# Altium schematic sheet top-sheet.SchDoc: CDR
size 420 x 297 mm; CheckedBy: E.Orzes F.Martina S.Baron; CompanyName: CERN; DrawnBy: E.Orzes; Organization: CERN; Address1: European Organization for Nuclear Research; Address2: CH-1211 Genève 23 - Switzerland; SheetNumber: 1; SheetTotal: 2; Projet: CDR Evalutation Board; DivGrp: EP-ESE; Designer: E.Orzes; ModifiedDate: -
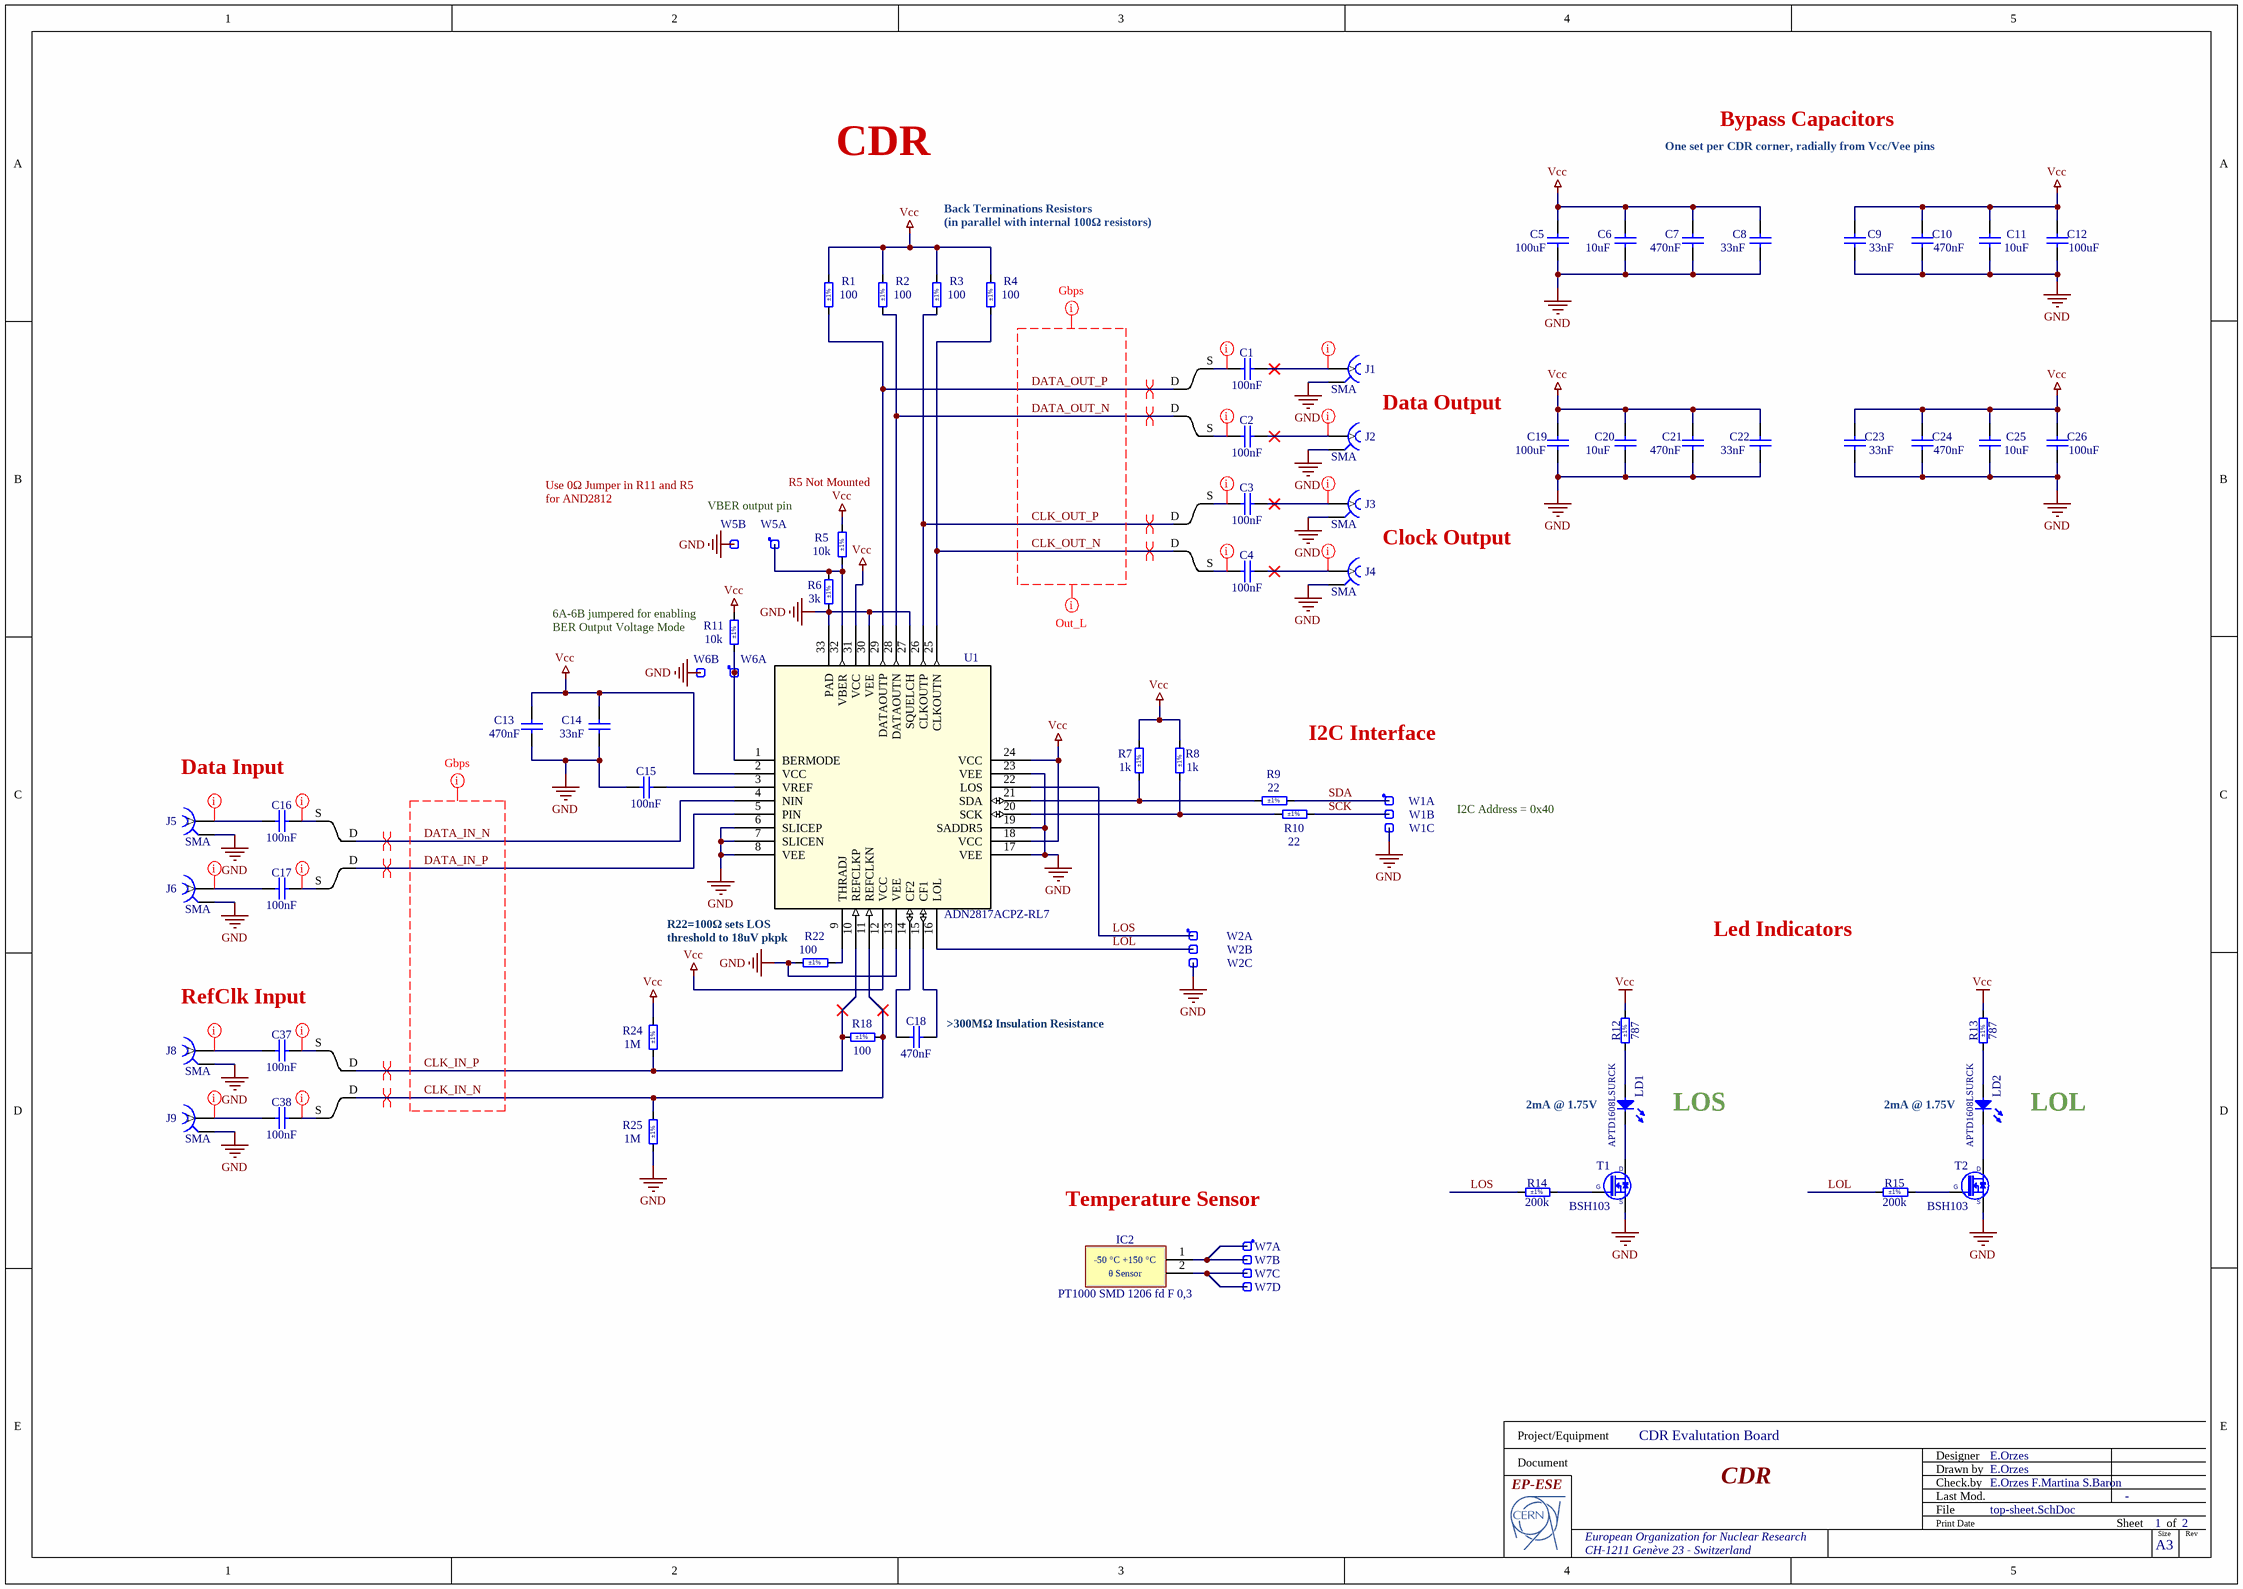
[diagram p0: top-sheet.SchDoc]

## Parts
C1  100nF  [CAPC0603X33N]
C2  100nF  [CAPC0603X33N]
C3  100nF  [CAPC0603X33N]
C4  100nF  [CAPC0603X33N]
C5  100uF  [CAPC3225X270N]
C6  10uF  [CAPC1608X87N]
C7  470nF  [CAPC0510X04N]
C8  33nF  [LLL03TR61E333KE01]
C9  33nF  [LLL03TR61E333KE01]
C10  470nF  [CAPC0510X04N]
C11  10uF  [CAPC1608X87N]
C12  100uF  [CAPC3225X270N]
C13  470nF  [CAPC0510X04N]
C14  33nF  [LLL03TR61E333KE01]
C15  100nF  [CAPC0603X33N]
C16  100nF  [CAPC0603X33N]
C17  100nF  [CAPC0603X33N]
C18  470nF  [CAPC2013X140N]
C19  100uF  [CAPC3225X270N]
C20  10uF  [CAPC1608X87N]
C21  470nF  [CAPC0510X04N]
C22  33nF  [LLL03TR61E333KE01]
C23  33nF  [LLL03TR61E333KE01]
C24  470nF  [CAPC0510X04N]
C25  10uF  [CAPC1608X87N]
C26  100uF  [CAPC3225X270N]
C37  100nF  [CAPC0603X33N]
C38  100nF  [CAPC0603X33N]
IC2  PT1000 SMD 1206 fd F 0,3  [DFN310X150X55-2N]
J1  SMA  [SAMTEC_SMA-J-P-H-ST-MT1]
J2  SMA  [SAMTEC_SMA-J-P-H-ST-MT1]
J3  SMA  [SAMTEC_SMA-J-P-H-ST-MT1]
J4  SMA  [SAMTEC_SMA-J-P-H-ST-MT1]
J5  SMA  [SAMTEC_SMA-J-P-H-ST-MT1]
J6  SMA  [SAMTEC_SMA-J-P-H-ST-MT1]
J8  SMA  [SAMTEC_SMA-J-P-H-ST-MT1]
J9  SMA  [SAMTEC_SMA-J-P-H-ST-MT1]
LD1  APTD1608LSURCK  [LED_KINGBRIGHT_KP-1608SURCK]
LD2  APTD1608LSURCK  [LED_KINGBRIGHT_KP-1608SURCK]
R1  100  Tolerance: ±1%  [RESC0603X28N]
R2  100  Tolerance: ±1%  [RESC0603X28N]
R3  100  Tolerance: ±1%  [RESC0603X28N]
R4  100  Tolerance: ±1%  [RESC0603X28N]
R5  10k  Tolerance: ±1%  [RESC1005X40N]
R6  3k  Tolerance: ±1%  [RESC1005X40N]
R7  1k  Tolerance: ±1%  [RESC1005X40N]
R8  1k  Tolerance: ±1%  [RESC1005X40N]
R9  22  Tolerance: ±1%  [RESC1005X40N]
R10  22  Tolerance: ±1%  [RESC1005X40N]
R11  10k  Tolerance: ±1%  [RESC1005X40N]
R12  787  Tolerance: ±1%  [RESC1005X40N]
R13  787  Tolerance: ±1%  [RESC1005X40N]
R14  200k  Tolerance: ±1%  [RESC1005X40N]
R15  200k  Tolerance: ±1%  [RESC1005X40N]
R18  100  Tolerance: ±1%  [RESC0603X28N]
R22  100  Tolerance: ±1%  [RESC0603X28N]
R24  1M  Tolerance: ±1%  [RESC1005X40N]
R25  1M  Tolerance: ±1%  [RESC1005X40N]
T1  BSH103  [SOT95P230X110-3N]
T2  BSH103  [SOT95P230X110-3N]
TA1  Differential to Single Transition  [lane_width_transition]  (value not drawn)  (net tie, no BOM)
TA2  Differential to Single Transition  [lane_width_transition]  (value not drawn)  (net tie, no BOM)
TA3  Differential to Single Transition  [lane_width_transition]  (value not drawn)  (net tie, no BOM)
TA4  Differential to Single Transition  [lane_width_transition]  (value not drawn)  (net tie, no BOM)
TA5  Differential to Single Transition  [lane_width_transition]  (value not drawn)  (net tie, no BOM)
TA6  Differential to Single Transition  [lane_width_transition]  (value not drawn)  (net tie, no BOM)
TA7  Differential to Single Transition  [lane_width_transition]  (value not drawn)  (net tie, no BOM)
TA8  Differential to Single Transition  [lane_width_transition]  (value not drawn)  (net tie, no BOM)
U1  ADN2817ACPZ-RL7  [CP_32_11_ADI]
W1  Header 3  [SAMTEC_HTSW-103-23-L-S]  (value not drawn)  (parts A,B,C of 3)
W2  Header 3  [SAMTEC_HTSW-103-23-L-S]  (value not drawn)  (parts A,B,C of 3)
W5  Header 2  [SAMTEC_HTSW-102-23-L-S]  (value not drawn)  (parts A,B of 2)
W6  Header 2  [SAMTEC_HTSW-102-23-L-S]  (value not drawn)  (parts A,B of 2)
W7  Header 4  [SAMTEC_HTSW-104-23-L-S]  (value not drawn)  (parts A,B,C,D of 4)

## Nets
GND: C5.1 C6.1 C7.1 C8.1 C9.1 C10.1 C11.1 C12.1 C13.1 C14.1 C15.1 C19.1 C20.1 C21.1 C22.1 C23.1 C24.1 C25.1 C26.1 J1.2 J2.2 J3.2 J4.2 J5.2 J6.2 J8.2 J9.2 R6.1 R22.1 R25.1 T1.2(S) T2.2(S) U1.6(SLICEP) U1.7(SLICEN) U1.8(VEE) U1.13(VEE) U1.17(VEE) U1.19(SADDR5) U1.23(VEE) U1.27(SQUELCH) U1.30(VEE) U1.33(PAD) W1.3 W2.3 W5.2 W6.2
Vcc: C5.2 C6.2 C7.2 C8.2 C9.2 C10.2 C11.2 C12.2 C13.2 C14.2 C19.2 C20.2 C21.2 C22.2 C23.2 C24.2 C25.2 C26.2 R1.2 R2.2 R3.2 R4.2 R5.2 R7.2 R8.2 R11.2 R12.2 R13.2 R24.2 U1.2(VCC) U1.12(VCC) U1.18(VCC) U1.24(VCC) U1.31(VCC)
CLK_IN_N: R18.2 R25.2 TA8.D U1.11(REFCLKN)
CLK_IN_P: R18.1 R24.1 TA7.D U1.10(REFCLKP)
CLK_OUT_N: R4.1 TA4.D U1.25(CLKOUTN)
CLK_OUT_P: R3.1 TA3.D U1.26(CLKOUTP)
DATA_IN_N: TA5.D U1.4(NIN)
DATA_IN_P: TA6.D U1.5(PIN)
DATA_OUT_N: R2.1 TA2.D U1.28(DATAOUTN)
DATA_OUT_P: R1.1 TA1.D U1.29(DATAOUTP)
LOL: R15.1 U1.16(LOL) W2.2
LOS: R14.1 U1.22(LOS) W2.1
SCK: R10.2 W1.2
SDA: R9.2 W1.1
NetC1_1: C1.1 TA1.S
NetC1_2: C1.2 J1.1
NetC2_1: C2.1 TA2.S
NetC2_2: C2.2 J2.1
NetC3_1: C3.1 TA3.S
NetC3_2: C3.2 J3.1
NetC4_1: C4.1 TA4.S
NetC4_2: C4.2 J4.1
NetC15_2: C15.2 U1.3(VREF)
NetC16_1: C16.1 J5.1
NetC16_2: C16.2 TA5.S
NetC17_1: C17.1 J6.1
NetC17_2: C17.2 TA6.S
NetC18_1: C18.1 U1.14(CF2)
NetC18_2: C18.2 U1.15(CF1)
NetC37_1: C37.1 J8.1
NetC37_2: C37.2 TA7.S
NetC38_1: C38.1 J9.1
NetC38_2: C38.2 TA8.S
NetIC2_1: IC2.1 W7.1 W7.2
NetIC2_2: IC2.2 W7.3 W7.4
NetLD1_1: LD1.1(C) T1.3(D)
NetLD1_2: LD1.2(A) R12.1
NetLD2_1: LD2.1(C) T2.3(D)
NetLD2_2: LD2.2(A) R13.1
NetR5_1: R5.1 R6.2 U1.32(VBER) W5.1
NetR7_1: R7.1 R9.1 U1.21(SDA)
NetR8_1: R8.1 R10.1 U1.20(SCK)
NetR11_1: R11.1 U1.1(BERMODE) W6.1
NetR14_2: R14.2 T1.1(G)
NetR15_2: R15.2 T2.1(G)
NetR22_2: R22.2 U1.9(THRADJ)

## Layout directives
differential pair: CLK_IN_N, CLK_IN_P, CLK_OUT_N, CLK_OUT_P, DATA_IN_N, DATA_IN_P, DATA_OUT_N, DATA_OUT_P
mark named Gbps: CLK_IN_N, CLK_IN_P, CLK_OUT_N, CLK_OUT_P, DATA_IN_N, DATA_IN_P, DATA_OUT_N, DATA_OUT_P
net class Output_Lanes: CLK_OUT_N, CLK_OUT_P, DATA_OUT_N, DATA_OUT_P
net class 50ohm: NetC1_1, NetC1_2, NetC2_1, NetC2_2, NetC3_1, NetC3_2, NetC4_1, NetC4_2, NetC16_1, NetC16_2, NetC17_1, NetC17_2, NetC37_1, NetC37_2, NetC38_1, NetC38_2

## Notes on the sheet
- Bypass Capacitors
- CDR
- One set per CDR corner, radially from Vcc/Vee pins
- Back Terminations Resistors
  (in parallel with internal 100Ω resistors)
- Data Output
- (near W5) Use 0Ω Jumper in R11 and R5 for AND2812
- (near W5) VBER output pin
- R5 Not Mounted
- Clock Output
- 6A-6B jumpered for enabling BER Output Voltage Mode
- Data Input
- I2C Interface
- I2C Address = 0x40
- (near U1) R22=100Ω sets LOS threshold to 18uV pkpk
- Led Indicators
- RefClk Input
- (near C18) >300MΩ Insulation Resistance
- (near LD1) 2mA @ 1.75V
- LOS
- (near LD2) 2mA @ 1.75V
- LOL
- Temperature Sensor
- Project/Equipment
- Document
- Designer
- Drawn by
- Check.by
- File
- Last Mod.
- Print Date
- Sheet
- Size
- A3
- of
- Rev
- (in symbol PT1000 SMD 1206 fd F 0,3) -50 °C +150 °C; θ Sensor

## Library data of the parts
C1-C4 C15-C17 C37 C38 = CC0201_100NF_6.3V_10%_X7R: Non-polarised capacitor; Part Description: SMD Multilayer Chip Ceramic Capacitor; Manufacturer: GENERIC; Manufacturer1 Part Number: CC0201KRX7R5BB104; Voltage: 6.3V; TC: X7R; Tolerance: ±10%; Part Number: CC0201_100NF_6.3V_10%_X7R; Component Kind: Standard; Component Type: Standard; Pin Count: 2; Value: 100nF; Status: Not Recommended; Manufacturer Part Number: CC0201_100NF_6.3V_10%_X7R; Case: 0201; Mounted: Yes; Socket: No; SMD: Yes; Sense: No; Manufacturer1 Example: YAGEO PHYCOMP; Manufacturer1 ComponentHeight: 0.33mm; HelpURL: \\cern.ch\dfs\Applications\Altium\Datasheets\CC0201_X7R_YAGEO_6.3VTO50V.pdf; Author: CERN DEM BC; CreateDate: 11/20/2020; LatestRevisionDate: 11/20/2020
C5 C12 C19 C26 = CC1210_100UF_6.3V_20%_X7U: GRM32EC70J107ME15; Part Description: SMD Multilayer Chip Ceramic Capacitor; Manufacturer: GENERIC; Manufacturer1 Part Number: GRM32EE70J107ME15L; Voltage: 6.3V; TC: X7U; Tolerance: ±20%; Part Number: CC1210_100UF_6.3V_20%_X7U; Component Kind: Standard; Component Type: Standard; Pin Count: 2; Value: 100uF; Status: None; Manufacturer Part Number: CC1210_100UF_6.3V_20%_X7U; Case: 1210; Mounted: Yes; Socket: No; SMD: Yes; Sense: No; Manufacturer1 Example: MURATA; Manufacturer1 ComponentHeight: 2.7mm; HelpURL: \\cern.ch\dfs\Applications\Altium\Datasheets\CC1210_X7U_MURATA.pdf; Author: CERN DEM MR; CreateDate: 10/12/2017; LatestRevisionDate: 10/12/2017
C6 C11 C20 C25 = CC0603_10UF_6.3V_20%_X5R: GRM188D71A106KA73; Part Description: SMD Multilayer Chip Ceramic Capacitor; Manufacturer: GENERIC; Manufacturer1 Part Number: C0603C106M9PAC; Voltage: 6.3V; TC: X5R; Tolerance: ±20%; Part Number: CC0603_10UF_6.3V_20%_X5R; Component Kind: Standard; Component Type: Standard; Pin Count: 2; Value: 10uF; Status: Preferred; Manufacturer Part Number: CC0603_10uF_6.3V_20%_X5R; Case: 0603; Mounted: Yes; Socket: No; SMD: Yes; Sense: No; Manufacturer1 Example: KEMET; Manufacturer1 ComponentHeight: 0.95mm; HelpURL: \\cern.ch\dfs\Applications\Altium\Datasheets\CC0603_X5R_KEMET.pdf; Author: CERN DEM JLC; CreateDate: 03/12/2007; LatestRevisionDate: 03/12/2007
C7 C10 C13 C21 C24 = Capacitor - non polarized: LLL153C70G474ME17; Value: 470nF
C8 C9 C14 C22 C23 = Capacitor - non polarized: LLL03TR61E333KE01; Value: 33nF
C18 = CC0805_470NF_50V_10%_X7R_MURATA_GCM21BR71H474KA55L: GCM21BR71H474KA55L; Part Description: SMD Chip Monolithic Ceramic Capacitor for Automotive; Manufacturer: MURATA; Voltage: 50V; TC: X7R; Tolerance: ±10%; Part Number: CC0805_470NF_50V_10%_X7R_MURATA_GCM21BR71H474KA55L; Component Kind: Standard; Component Type: Standard; Pin Count: 2; Value: 470nF; Status: Not Recommended; Manufacturer Part Number: GCM21BR71H474KA55L; Case: 0805; Mounted: Yes; Socket: No; SMD: Yes; Sense: No; ComponentHeight: 1.4mm; HelpURL: \\cern.ch\dfs\Applications\Altium\Datasheets\CC0805_MURATA_GCM21BR71H474KA55L.pdf; Author: CERN DEM JLC; CreateDate: 5/10/2017; LatestRevisionDate: 5/10/2017
IC2 = PT1000 SMD 1206 fd F 0,3: 2 Pin Temperature Sensor; Part Description: -50°C to +150°C, 1000 Ohm at 0°C Platinum Temperature Sensor; Manufacturer: UMWELTSENSORTECHNIK GmbH (UST); PressFit: No; Bonding: No; Part Number: PT1000 SMD 1206 fd F 0,3; Component Kind: Standard; Component Type: Standard; Device: PT1000 SMD 1206 fd F 0,3; PackageDescription: DFN; 2 Pin,3.10mm L X 1.50mm W X 0.40mm H, IPC Medium Density; Manufacturer Part Number: PT1000 SMD 1206 fd F 0,3; Pin Count: 2; Case: DFN2; Mounted: Yes; Socket: No; SMD: Yes; Sense: No; ComponentHeight: 0.55mm; HelpURL: \\cern.ch\dfs\Applications\Altium\Datasheets\PT1000 SMD 1206 fd.pdf; Author: CERN DEM JLC; CreateDate: 8/20/2018; LatestRevisionDate: 8/22/2018
J1-J6 J8 J9 = SAMTEC_SMA-J-P-H-ST-MT1: Part Description: 50 Ohms SMA Straight Mixed Technology PCB Jack; Manufacturer: SAMTEC; PressFit: No; Sense Comment: assembly limitations; Part Number: SAMTEC_SMA-J-P-H-ST-MT1; Component Kind: Standard; Component Type: Standard; Pin Count: 5; Family: SMA; Mounted: Yes; Socket: No; SMD: Yes; Sense: Yes; Status: Not Recommended; Manufacturer Part Number: SMA-J-P-H-ST-MT1; ComponentHeight: 7.95mm; HelpURL: \\cern.ch\dfs\Applications\Altium\Datasheets\SAMTEC_SMA-J-P-H-ST-MT1.pdf; Author: CERN DEM HF; CreateDate: 5/24/2023; LatestRevisionDate: 5/24/2023
LD1 LD2 = LED_KINGBRIGHT_KP-1608SURCK: LED Red 1C 2A; Part Description: 1.6x0.8mm SMD Chip Hyper Red LED Lamp; PressFit: No; Bonding: No; Part Number: LED_KINGBRIGHT_KP-1608SURCK; Component Kind: Standard; Component Type: Standard; Color: Red; PackageDescription: SMT Hyper Red LED, Case 0603, Body L 1.60mm x W 0.80mm x H 1.10mm; Manufacturer: KINGBRIGHT; Manufacturer Part Number: KP-1608SURCK; Pin Count: 2; Case: 0603; Mounted: Yes; Socket: No; SMD: Yes; Sense: No; ComponentHeight: 1.1mm; HelpURL: \\cern.ch\dfs\Applications\Altium\Datasheets\LED_KINGBRIGHT_KP-1608SURCK.pdf; Author: CERN DEM HF; CreateDate: 10/1/2021; LatestRevisionDate: 10/1/2021
R1-R4 R18 R22 = R0201_100R_1%_0.05W_200PPM: Resistor - 1%; Part Description: Thick Film Chip Resistor; Manufacturer: GENERIC; Manufacturer1 Part Number: CRCW0201100RFNED; Power: 0.05W; TC: ±200ppm/°C; PressFit: No; Part Number: R0201_100R_1%_0.05W_200PPM; Component Kind: Standard; Component Type: Standard; Pin Count: 2; Value: 100; Status: Not Recommended; Manufacturer Part Number: R0201_100R_1%_0.05W_200PPM; Case: 0201; Mounted: Yes; Sense: No; Socket: No; SMD: Yes; Manufacturer1 Example: VISHAY; Manufacturer1 ComponentHeight: 0.27mm; HelpURL: \\cern.ch\dfs\Applications\Altium\Datasheets\R0201_VISHAY_CRCW e3.pdf; Author: CERN DEM JLC; CreateDate: 11/13/2014; LatestRevisionDate: 11/13/2014
R5 = R0402_10K_1%_0.0625W_100PPM: Resistor - 1%; Part Description: General Purpose Thick Film Chip Resistor; Manufacturer: GENERIC; Manufacturer1 Part Number: 232270671003L; TC: ±100ppm/°C; PressFit: No; Mounted: No; Part Number: R0402_10K_1%_0.0625W_100PPM; Component Kind: Standard; Component Type: Standard; Pin Count: 2; Value: 10k; Status: Not Recommended; Power: 0.0625W; Manufacturer Part Number: R0402_10K_1%_0.0625W_100PPM; Case: 0402; Sense: No; Socket: No; SMD: Yes; Manufacturer1 Example: YAGEO PHYCOMP; Manufacturer1 ComponentHeight: 0.4mm; HelpURL: \\cern.ch\dfs\Applications\Altium\Datasheets\R0402_Phycomp_RC0402.pdf; Author: CERN DEM JLC; CreateDate: 12/3/2007; LatestRevisionDate: 10/17/2012
R6 = R0402_3K_1%_0.0625W_100PPM: Resistor - 1%; Part Description: General Purpose Thick Film Chip Resistor; Manufacturer: GENERIC; Manufacturer1 Part Number: 232270673002L; TC: ±100ppm/°C; PressFit: No; Part Number: R0402_3K_1%_0.0625W_100PPM; Component Kind: Standard; Component Type: Standard; Pin Count: 2; Value: 3k; Status: Not Recommended; Power: 0.0625W; Manufacturer Part Number: R0402_3K_1%_0.0625W_100PPM; Case: 0402; Mounted: Yes; Sense: No; Socket: No; SMD: Yes; Manufacturer1 Example: YAGEO PHYCOMP; Manufacturer1 ComponentHeight: 0.4mm; HelpURL: \\cern.ch\dfs\Applications\Altium\Datasheets\R0402_Phycomp_RC0402.pdf; Author: CERN DEM JLC; CreateDate: 12/3/2007; LatestRevisionDate: 10/17/2012
R7 R8 = R0402_1K_1%_0.0625W_100PPM: Resistor - 1%; Part Description: General Purpose Thick Film Chip Resistor; Manufacturer: GENERIC; Manufacturer1 Part Number: 232270671002L; TC: ±100ppm/°C; PressFit: No; Part Number: R0402_1K_1%_0.0625W_100PPM; Component Kind: Standard; Component Type: Standard; Pin Count: 2; Value: 1k; Status: Not Recommended; Power: 0.0625W; Manufacturer Part Number: R0402_1K_1%_0.0625W_100PPM; Case: 0402; Mounted: Yes; Sense: No; Socket: No; SMD: Yes; Manufacturer1 Example: YAGEO PHYCOMP; Manufacturer1 ComponentHeight: 0.4mm; HelpURL: \\cern.ch\dfs\Applications\Altium\Datasheets\R0402_Phycomp_RC0402.pdf; Author: CERN DEM JLC; CreateDate: 12/3/2007; LatestRevisionDate: 10/17/2012
R9 R10 = R0402_22R_1%_0.0625W_100PPM: Resistor - 1%; Part Description: General Purpose Thick Film Chip Resistor; Manufacturer: GENERIC; Manufacturer1 Part Number: 232270672209L; TC: ±100ppm/°C; PressFit: No; Part Number: R0402_22R_1%_0.0625W_100PPM; Component Kind: Standard; Component Type: Standard; Pin Count: 2; Value: 22; Status: Not Recommended; Power: 0.0625W; Manufacturer Part Number: R0402_22R_1%_0.0625W_100PPM; Case: 0402; Mounted: Yes; Sense: No; Socket: No; SMD: Yes; Manufacturer1 Example: YAGEO PHYCOMP; Manufacturer1 ComponentHeight: 0.4mm; HelpURL: \\cern.ch\dfs\Applications\Altium\Datasheets\R0402_Phycomp_RC0402.pdf; Author: CERN DEM JLC; CreateDate: 12/3/2007; LatestRevisionDate: 10/17/2012
R11 = R0402_10K_1%_0.0625W_100PPM: Resistor - 1%; Part Description: General Purpose Thick Film Chip Resistor; Manufacturer: GENERIC; Manufacturer1 Part Number: 232270671003L; TC: ±100ppm/°C; PressFit: No; Part Number: R0402_10K_1%_0.0625W_100PPM; Component Kind: Standard; Component Type: Standard; Pin Count: 2; Value: 10k; Status: Not Recommended; Power: 0.0625W; Manufacturer Part Number: R0402_10K_1%_0.0625W_100PPM; Case: 0402; Mounted: Yes; Sense: No; Socket: No; SMD: Yes; Manufacturer1 Example: YAGEO PHYCOMP; Manufacturer1 ComponentHeight: 0.4mm; HelpURL: \\cern.ch\dfs\Applications\Altium\Datasheets\R0402_Phycomp_RC0402.pdf; Author: CERN DEM JLC; CreateDate: 12/3/2007; LatestRevisionDate: 10/17/2012
R12 R13 = R0402_787R_1%_0.1W_100PPM: Resistor - 1%; Part Description: General Purpose Thick Film Chip Resistor; Manufacturer: GENERIC; Manufacturer1 Part Number: ERJ2RKF7870X; Power: 0.1W; TC: ±100ppm/°C; Voltage: 50V; PressFit: No; Part Number: R0402_787R_1%_0.1W_100PPM; Component Kind: Standard; Component Type: Standard; Pin Count: 2; Value: 787; Status: Not Recommended; Manufacturer Part Number: R0402_787R_1%_0.1W_100PPM; Case: 0402; Mounted: Yes; Sense: No; Socket: No; SMD: Yes; Manufacturer1 Example: PANASONIC; Manufacturer1 ComponentHeight: 0.4mm; HelpURL: \\cern.ch\dfs\Applications\Altium\Datasheets\R0402_PANASONIC_ERJ2RK.pdf; Author: CERN DEM BC; CreateDate: 9/14/2020; LatestRevisionDate: 9/14/2020
R14 R15 = R0402_200K_1%_0.0625W_100PPM: Resistor - 1%; Part Description: General Purpose Thick Film Chip Resistor; Manufacturer: GENERIC; Manufacturer1 Part Number: 232270672004L; TC: ±100ppm/°C; PressFit: No; Part Number: R0402_200K_1%_0.0625W_100PPM; Component Kind: Standard; Component Type: Standard; Pin Count: 2; Value: 200k; Status: Not Recommended; Power: 0.0625W; Manufacturer Part Number: R0402_200K_1%_0.0625W_100PPM; Case: 0402; Mounted: Yes; Sense: No; Socket: No; SMD: Yes; Manufacturer1 Example: YAGEO PHYCOMP; Manufacturer1 ComponentHeight: 0.4mm; HelpURL: \\cern.ch\dfs\Applications\Altium\Datasheets\R0402_Phycomp_RC0402.pdf; Author: CERN DEM JLC; CreateDate: 12/3/2007; LatestRevisionDate: 10/17/2012
R24 R25 = R0402_1M_1%_0.0625W_100PPM: Resistor - 1%; Part Description: General Purpose Thick Film Chip Resistor; Manufacturer: GENERIC; Manufacturer1 Part Number: 232270671005L; TC: ±100ppm/°C; PressFit: No; Part Number: R0402_1M_1%_0.0625W_100PPM; Component Kind: Standard; Component Type: Standard; Pin Count: 2; Value: 1M; Status: Not Recommended; Power: 0.0625W; Manufacturer Part Number: R0402_1M_1%_0.0625W_100PPM; Case: 0402; Mounted: Yes; Sense: No; Socket: No; SMD: Yes; Manufacturer1 Example: YAGEO PHYCOMP; Manufacturer1 ComponentHeight: 0.4mm; HelpURL: \\cern.ch\dfs\Applications\Altium\Datasheets\R0402_Phycomp_RC0402.pdf; Author: CERN DEM JLC; CreateDate: 12/3/2007; LatestRevisionDate: 10/17/2012
T1 T2 = BSH103: N-CHANNEL MOSFET WITH DIODE; Part Description: 30V, 850mA N-Channel Enhancement Mode Field-Effect Transistor; Manufacturer: NEXPERIA; PressFit: No; Bonding: No; Part Number: BSH103; Component Kind: Standard; Component Type: Standard; Device: BSH103; PackageDescription: SOT23, 0.95mm Pitch; 3 Pin, 1.30mm W X 2.90mm L X 1.10mm H body, IPC Medium Density; Manufacturer Part Number: BSH103; Pin Count: 3; Case: SOT23-3; Mounted: Yes; Socket: No; SMD: Yes; Sense: No; ComponentHeight: 1.1mm; HelpURL: \\cern.ch\dfs\Applications\Altium\Datasheets\BSH103.pdf; Author: CERN DEM JLC; CreateDate: 16/03/2010; LatestRevisionDate: 20/06/2017
TA1-TA8 = lane_width_transition
U1 = ADN2817ACPZ-RL7: No Description Available; Mfr_Name: Analog Devices Inc; RefDes: RefDes; Type: Type
W1 W2 = SAMTEC_HTSW-103-23-L-S: 3 Mini Wire-Wrap Contact Strip Header; Part Description: 3 Contacts, Pitch 2.54mm, Single Row Through Mount Straight Header (Post Lead 5.84mm, Tail Lead 2.92mm, Insulator 2.54mm); Manufacturer: SAMTEC; PressFit: No; Status Comment: High Temperature; Part Number: SAMTEC_HTSW-103-23-L-S; Component Kind: Standard; Component Type: Standard; Pin Count: 3; Family: Header 3; Mounted: Yes; Socket: No; SMD: No; Sense: No; Status: Preferred; Manufacturer Part Number: HTSW-103-23-L-S; ComponentHeight: 8.38mm; HelpURL: \\cern.ch\dfs\Applications\Altium\Datasheets\SAMTEC_HTSW-103-23-L-S.pdf; Author: CERN DEM JLC; CreateDate: 2/22/2018; LatestRevisionDate: 2/22/2018
W5 W6 = SAMTEC_HTSW-102-23-L-S: 2 Mini Wire-Wrap Contact Strip Header; Part Description: 2 Contacts, Pitch 2.54mm, Single Row  Through Mount Straight Header (Post Lead 5.84mm, Tail Lead 2.92mm, Insulator 2.54mm); Manufacturer: SAMTEC; PressFit: No; Status Comment: High Temperature; Part Number: SAMTEC_HTSW-102-23-L-S; Component Kind: Standard; Component Type: Standard; Pin Count: 2; Family: Header 2; Mounted: Yes; Socket: No; SMD: No; Sense: No; Status: Preferred; Manufacturer Part Number: HTSW-102-23-L-S; ComponentHeight: 8.38mm; HelpURL: \\cern.ch\dfs\Applications\Altium\Datasheets\SAMTEC_HTSW-102-23-L-S.pdf; Author: CERN DEM JLC; CreateDate: 2/22/2018; LatestRevisionDate: 2/22/2018
W7 = SAMTEC_HTSW-104-23-L-S: 4 Mini Wire-Wrap Contact Strip Header; Part Description: 4 Contacts, Pitch 2.54mm, Single Row  Through Mount Straight Header (Post Lead 5.84mm, Tail Lead 2.92mm, Insulator 2.54mm); Manufacturer: SAMTEC; PressFit: No; Status Comment: High Temperature; Part Number: SAMTEC_HTSW-104-23-L-S; Component Kind: Standard; Component Type: Standard; Pin Count: 4; Family: Header 4; Mounted: Yes; Socket: No; SMD: No; Sense: No; Status: Preferred; Manufacturer Part Number: HTSW-104-23-L-S; ComponentHeight: 8.38mm; HelpURL: \\cern.ch\dfs\Applications\Altium\Datasheets\SAMTEC_HTSW-104-23-L-S.pdf; Author: CERN DEM JLC; CreateDate: 2/22/2018; LatestRevisionDate: 2/22/2018